# Altium schematic sheet SDRAM.SchDoc: SDRAM
size A4; DocumentNumber: 6; SheetNumber: 5; SheetTotal: 16
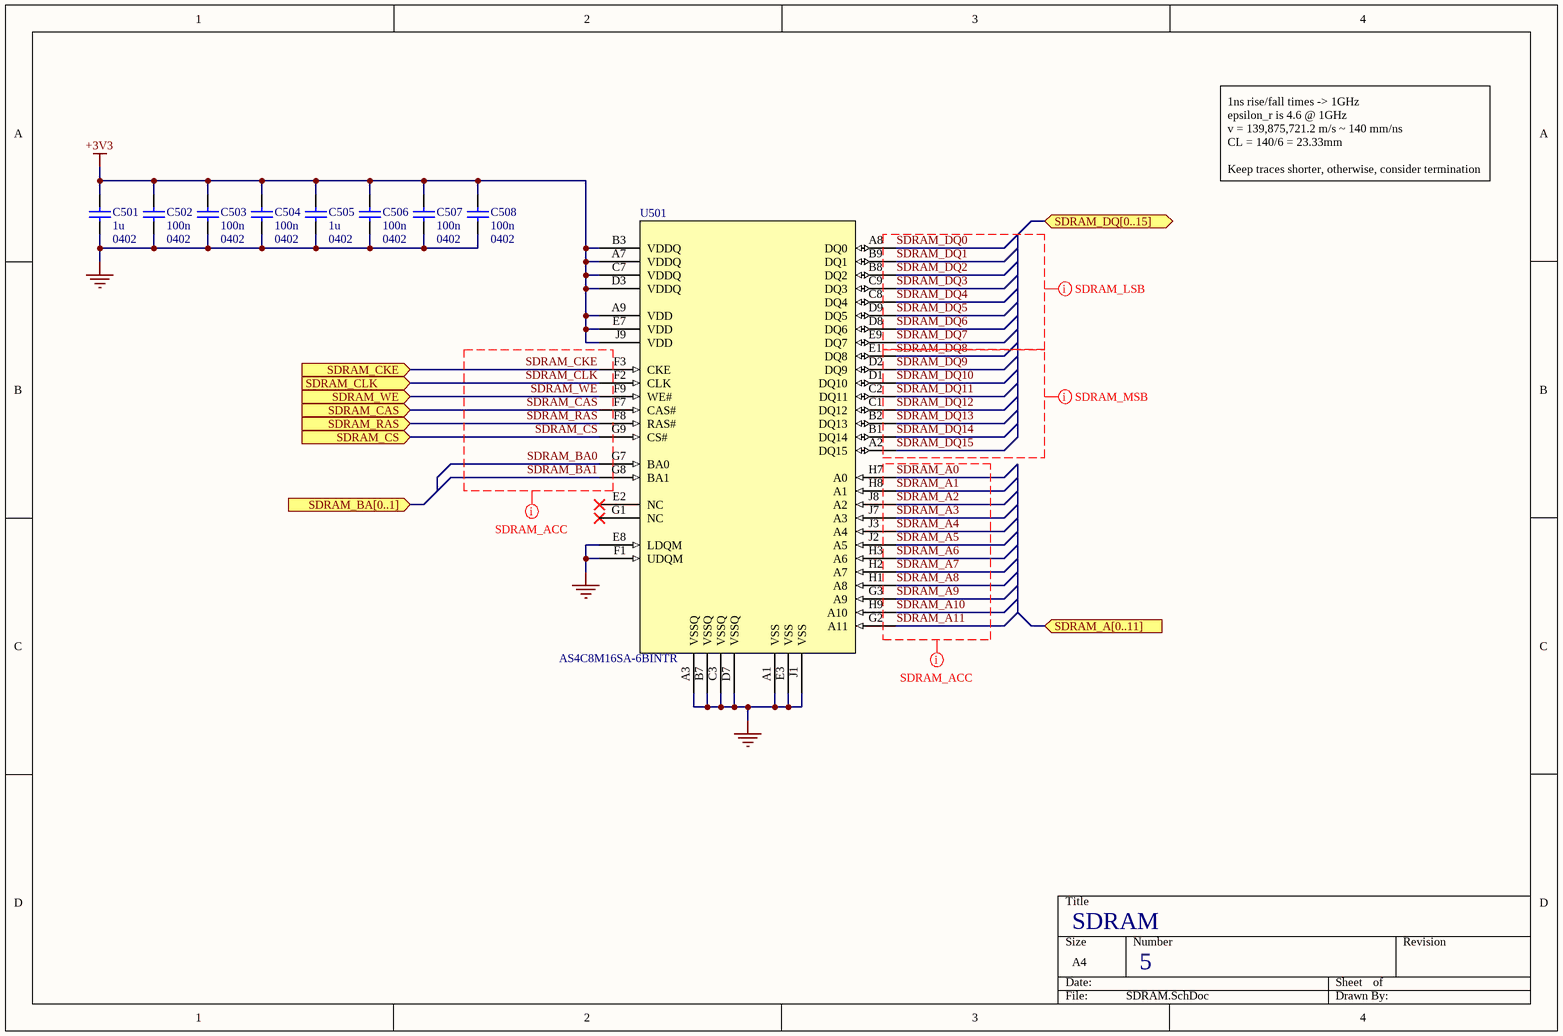
[diagram p0: SDRAM.SchDoc]

## Parts
C501  1u  Footprint: 0402  [CAP_0402_B]
C502  100n  Footprint: 0402  [CAP_0402_B]
C503  100n  Footprint: 0402  [CAP_0402_B]
C504  100n  Footprint: 0402  [CAP_0402_B]
C505  1u  Footprint: 0402  [CAP_0402_B]
C506  100n  Footprint: 0402  [CAP_0402_B]
C507  100n  Footprint: 0402  [CAP_0402_B]
C508  100n  Footprint: 0402  [CAP_0402_B]
U501  AS4C8M16SA-6BINTR  [AS4C8M16SA-6BINTR]

## Ports
SDRAM_A[0..11] (in, see Top_Level[2B], MCU[3A]), SDRAM_BA[0..1] (in, see Top_Level[2B], MCU[3A]), SDRAM_CAS (in, see Top_Level[2C], MCU[3A]), SDRAM_CKE (in, see Top_Level[2B], MCU[3A]), SDRAM_CLK (in, see Top_Level[2C], MCU[3A]), SDRAM_CS (in, see Top_Level[2C], MCU[3A]), SDRAM_DQ[0..15] (bidir, see Top_Level[2B], MCU[3A]), SDRAM_RAS (in, see Top_Level[2C], MCU[3A]), SDRAM_WE (in, see Top_Level[2C], MCU[3A])

## Nets
+3V3: C501.1 C502.1 C503.1 C504.1 C505.1 C506.1 C507.1 C508.1 U501.A7(VDDQ) U501.A9(VDD) U501.B3(VDDQ) U501.C7(VDDQ) U501.D3(VDDQ) U501.E7(VDD) U501.J9(VDD)
GND: C501.2 C502.2 C503.2 C504.2 C505.2 C506.2 C507.2 C508.2 U501.A1(VSS) U501.A3(VSSQ) U501.B7(VSSQ) U501.C3(VSSQ) U501.D7(VSSQ) U501.E3(VSS) U501.E8(LDQM) U501.F1(UDQM) U501.J1(VSS)
SDRAM_A0: U501.H7(A0)
SDRAM_A1: U501.H8(A1)
SDRAM_A2: U501.J8(A2)
SDRAM_A3: U501.J7(A3)
SDRAM_A4: U501.J3(A4)
SDRAM_A5: U501.J2(A5)
SDRAM_A6: U501.H3(A6)
SDRAM_A7: U501.H2(A7)
SDRAM_A8: U501.H1(A8)
SDRAM_A9: U501.G3(A9)
SDRAM_A10: U501.H9(A10)
SDRAM_A11: U501.G2(A11)
SDRAM_BA0: U501.G7(BA0)
SDRAM_BA1: U501.G8(BA1)
SDRAM_CAS: U501.F7(CAS#) ; port SDRAM_CAS
SDRAM_CKE: U501.F3(CKE) ; port SDRAM_CKE
SDRAM_CLK: U501.F2(CLK) ; port SDRAM_CLK
SDRAM_CS: U501.G9(CS#) ; port SDRAM_CS
SDRAM_DQ0: U501.A8(DQ0)
SDRAM_DQ1: U501.B9(DQ1)
SDRAM_DQ2: U501.B8(DQ2)
SDRAM_DQ3: U501.C9(DQ3)
SDRAM_DQ4: U501.C8(DQ4)
SDRAM_DQ5: U501.D9(DQ5)
SDRAM_DQ6: U501.D8(DQ6)
SDRAM_DQ7: U501.E9(DQ7)
SDRAM_DQ8: U501.E1(DQ8)
SDRAM_DQ9: U501.D2(DQ9)
SDRAM_DQ10: U501.D1(DQ10)
SDRAM_DQ11: U501.C2(DQ11)
SDRAM_DQ12: U501.C1(DQ12)
SDRAM_DQ13: U501.B2(DQ13)
SDRAM_DQ14: U501.B1(DQ14)
SDRAM_DQ15: U501.A2(DQ15)
SDRAM_RAS: U501.F8(RAS#) ; port SDRAM_RAS
SDRAM_WE: U501.F9(WE#) ; port SDRAM_WE

Not connected (* = marked no-connect by the designer): U501 E2(NC)* G1(NC)*

## Layout directives
net class SDRAM_LSB: SDRAM_DQ0, SDRAM_DQ1, SDRAM_DQ2, SDRAM_DQ3, SDRAM_DQ4, SDRAM_DQ5, SDRAM_DQ6, SDRAM_DQ7
net class SDRAM_ACC: SDRAM_A0, SDRAM_A1, SDRAM_A2, SDRAM_A3, SDRAM_A4, SDRAM_A5, SDRAM_A6, SDRAM_A7, SDRAM_A8, SDRAM_A9, SDRAM_A10, SDRAM_A11, SDRAM_BA0, SDRAM_BA1, SDRAM_CAS, SDRAM_CKE, SDRAM_CLK, SDRAM_CS, SDRAM_RAS, SDRAM_WE
net class SDRAM_MSB: SDRAM_DQ8, SDRAM_DQ9, SDRAM_DQ10, SDRAM_DQ11, SDRAM_DQ12, SDRAM_DQ13, SDRAM_DQ14, SDRAM_DQ15

## Notes on the sheet
- 1ns rise/fall times -> 1GHz
  epsilon_r is 4.6 @ 1GHz
  v = 139,875,721.2 m/s ~ 140 mm/ns
  CL = 140/6 = 23.33mm
  Keep traces shorter, otherwise, consider termination

## Library data of the parts
C501-C508 = CAP_0402: 0402 SMD Capacitor
U501 = AS4C8M16SA-6BINTR: SDRAM Memory IC 128Mbit Parallel 166 MHz 5 ns 54-TFBGA (8x8); Supplier 1: DigiKey; Supplier Part Number 1: 1450-AS4C8M16SA-6BINCT-ND